# Altium project TC264.PrjPcb
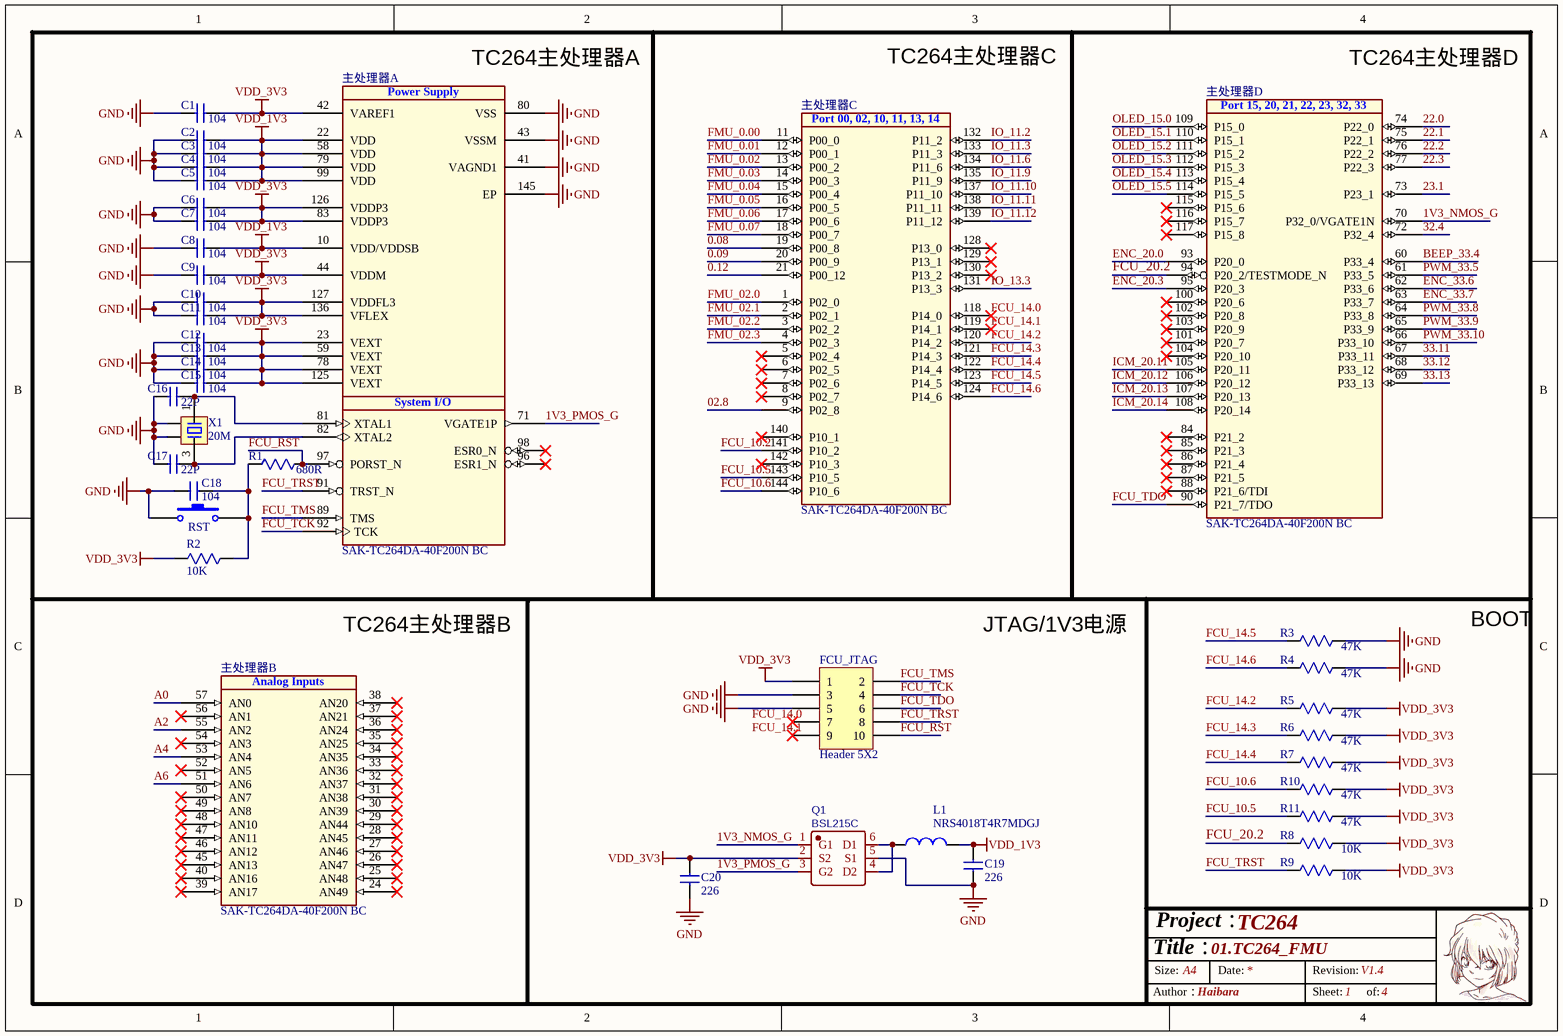
[diagram p0: 01.TC264_FMU.SchDoc]
3 sheets, 121 parts. Net scope: global (net labels, ports and power ports of the same name join across sheets).
Board file: TC264.PcbDoc
Sheets:
  01.TC264_FMU.SchDoc
  02.Power_Uint.SchDoc
  03.Communicate.SchDoc

## Sheet 01.TC264_FMU.SchDoc: 01.TC264_FMU
size A4; Revision: V1.4; SheetNumber: 1; SheetTotal: 4; Project: TC264

### Parts
C1  104  [C0402]
C2  104  [C0402]
C3  104  [C0402]
C4  104  [C0402]
C5  104  [C0402]
C6  104  [C0402]
C7  104  [C0402]
C8  104  [C0402]
C9  104  [C0402]
C10  104  [C0402]
C11  104  [C0402]
C12  104  [C0402]
C13  104  [C0402]
C14  104  [C0402]
C15  104  [C0402]
C16  22P  [C0603]
C17  22P  [C0603]
C18  104  [C0402]
C19  226  [C0805]
C20  226  [C0805]
FCU_JTAG  Header 5X2  [DC-2.54-L-Z-10P]
L1  NRS4018T4R7MDGJ  [SWPA4030S]
Q1  BSL215C  [SOT23-6]
R1  680R  [R0402]
R2  10K  [R0402]
R3  47K  [R0402]
R4  47K  [R0402]
R5  47K  [R0402]
R6  47K  [R0402]
R7  47K  [R0402]
R8  10K  [R0402]
R9  10K  [R0402]
R10  47K  [R0402]
R11  47K  [R0402]
RST  SW-PB  [TSW SMD-3*6*2.5]  (value not drawn)
X1  20M  [OSC 3225-4P]
主处理器  SAK-TC264DA-40F200N BC  [QFP144_EP]  (parts A,B,C,D of 4)

### Nets
GND: C1.1 C2.1 C3.1 C4.1 C5.1 C6.1 C7.1 C8.1 C9.1 C10.1 C11.1 C12.1 C13.1 C14.1 C15.1 C16.1 C17.1 C18.1 C19.1 C20.1 FCU_JTAG.3 FCU_JTAG.5 Q1.5(S1) R3.2 R4.2 RST.1 X1.2 X1.4 主处理器.41(VAGND1) 主处理器.43(VSSM) 主处理器.80(VSS) 主处理器.145(EP)
VDD_1V3: C2.2 C3.2 C4.2 C5.2 C8.2 C19.2 L1.2 主处理器.10(VDD/VDDSB) 主处理器.22(VDD) 主处理器.58(VDD) 主处理器.79(VDD) 主处理器.99(VDD)
VDD_3V3: C1.2 C6.2 C7.2 C9.2 C10.2 C11.2 C12.2 C13.2 C14.2 C15.2 C20.2 FCU_JTAG.1 Q1.2(S2) R2.1 R5.2 R6.2 R7.2 R8.2 R9.2 R10.2 R11.2 主处理器.23(VEXT) 主处理器.42(VAREF1) 主处理器.44(VDDM) 主处理器.59(VEXT) 主处理器.78(VEXT) 主处理器.83(VDDP3) 主处理器.125(VEXT) 主处理器.126(VDDP3) 主处理器.127(VDDFL3) 主处理器.136(VFLEX)
0.08: 主处理器.19(P00_8)
0.09: 主处理器.20(P00_9)
0.12: 主处理器.21(P00_12)
1V3_NMOS_G: Q1.1(G1) 主处理器.70(P32_0/VGATE1N)
1V3_PMOS_G: Q1.3(G2) 主处理器.71(VGATE1P)
02.8: 主处理器.9(P02_8)
22.0: 主处理器.74(P22_0)
22.1: 主处理器.75(P22_1)
22.2: 主处理器.76(P22_2)
22.3: 主处理器.77(P22_3)
23.1: 主处理器.73(P23_1)
32.4: 主处理器.72(P32_4)
33.11: 主处理器.67(P33_11)
33.12: 主处理器.68(P33_12)
33.13: 主处理器.69(P33_13)
A0: 主处理器.57(AN0)
A2: 主处理器.55(AN2)
A4: 主处理器.53(AN4)
A6: 主处理器.51(AN6)
BEEP_33.4: 主处理器.60(P33_4)
ENC_20.0: 主处理器.93(P20_0)
ENC_20.3: 主处理器.95(P20_3)
ENC_33.6: 主处理器.62(P33_6)
ENC_33.7: 主处理器.63(P33_7)
FCU_10.2: 主处理器.141(P10_2)
FCU_10.5: R11.1 主处理器.143(P10_5)
FCU_10.6: R10.1 主处理器.144(P10_6)
FCU_14.0: 主处理器.118(P14_0)
FCU_14.1: 主处理器.119(P14_1)
FCU_14.2: R5.1 主处理器.120(P14_2)
FCU_14.3: R6.1 主处理器.121(P14_3)
FCU_14.4: R7.1 主处理器.122(P14_4)
FCU_14.5: R3.1 主处理器.123(P14_5)
FCU_14.6: R4.1 主处理器.124(P14_6)
FCU_20.2: R8.1 主处理器.94(P20_2/TESTMODE_N)
FCU_RST: FCU_JTAG.10 R1.2 主处理器.97(PORST_N)
FCU_TCK: FCU_JTAG.4 主处理器.92(TCK)
FCU_TDO: FCU_JTAG.6 主处理器.90(P21_7/TDO)
FCU_TMS: FCU_JTAG.2 主处理器.89(TMS)
FCU_TRST: FCU_JTAG.8 R9.1 主处理器.91(TRST_N)
FMU_0.00: 主处理器.11(P00_0)
FMU_0.01: 主处理器.12(P00_1)
FMU_0.02: 主处理器.13(P00_2)
FMU_0.03: 主处理器.14(P00_3)
FMU_0.04: 主处理器.15(P00_4)
FMU_0.05: 主处理器.16(P00_5)
FMU_0.06: 主处理器.17(P00_6)
FMU_0.07: 主处理器.18(P00_7)
FMU_02.0: 主处理器.1(P02_0)
FMU_02.1: 主处理器.2(P02_1)
FMU_02.2: 主处理器.3(P02_2)
FMU_02.3: 主处理器.4(P02_3)
ICM_20.11: 主处理器.105(P20_11)
ICM_20.12: 主处理器.106(P20_12)
ICM_20.13: 主处理器.107(P20_13)
ICM_20.14: 主处理器.108(P20_14)
IO_11.2: 主处理器.132(P11_2)
IO_11.3: 主处理器.133(P11_3)
IO_11.6: 主处理器.134(P11_6)
IO_11.9: 主处理器.135(P11_9)
IO_11.10: 主处理器.137(P11_10)
IO_11.11: 主处理器.138(P11_11)
IO_11.12: 主处理器.139(P11_12)
IO_13.3: 主处理器.131(P13_3)
OLED_15.0: 主处理器.109(P15_0)
OLED_15.1: 主处理器.110(P15_1)
OLED_15.2: 主处理器.111(P15_2)
OLED_15.3: 主处理器.112(P15_3)
OLED_15.4: 主处理器.113(P15_4)
OLED_15.5: 主处理器.114(P15_5)
PWM_33.5: 主处理器.61(P33_5)
PWM_33.8: 主处理器.64(P33_8)
PWM_33.9: 主处理器.65(P33_9)
PWM_33.10: 主处理器.66(P33_10)
NetC16_2: C16.2 X1.1 主处理器.81(XTAL1)
NetC17_2: C17.2 X1.3 主处理器.82(XTAL2)
NetC18_2: C18.2 R1.1 R2.2 RST.2
NetL1_1: L1.1 Q1.4(D2) Q1.6(D1)

Not connected (* = marked no-connect by the designer): FCU_JTAG 7* 9*; 主处理器 5(P02_4)* 6(P02_5)* 7(P02_6)* 8(P02_7)* 24(AN49)* 25(AN48)* 26(AN47)* 27(AN46)* 28(AN45)* 29(AN44)* 30(AN39)* 31(AN38)* 32(AN37)* 33(AN36)* 34(AN35)* 35(AN25)* 36(AN24)* 37(AN21)* 38(AN20)* 39(AN17)* 40(AN16)* 45(AN13)* 46(AN12)* 47(AN11)* 48(AN10)* 49(AN8)* 50(AN7)* 52(AN5)* 54(AN3)* 56(AN1)* 84(P21_2)* 85(P21_3)* 86(P21_4)* 87(P21_5)* 88(P21_6/TDI)* 96(ESR1_N)* 98(ESR0_N)* 100(P20_6)* 101(P20_7)* 102(P20_8)* 103(P20_9)* 104(P20_10)* 115(P15_6)* 116(P15_7)* 117(P15_8)* 128(P13_0)* 129(P13_1)* 130(P13_2)* 140(P10_1)* 142(P10_3)*

### Notes on the sheet
- (near 主处理器) TC264主处理器A
- TC264主处理器C
- TC264主处理器D
- TC264主处理器B
- JTAG/1V3电源
- BOOT
- Labels drawn without touching a wire or pin: FCU_14.0, FCU_14.1
- Title：
- Size:
- Project：
- A4
- Date:
- Revision:
- Author：
- Haibara
- Sheet:
- of:
- (in symbol SAK-TC264DA-40F200N BC, part A) Power Supply; System I/O
- (in symbol SAK-TC264DA-40F200N BC, part B) Analog Inputs
- (in symbol SAK-TC264DA-40F200N BC, part C) Port 00, 02, 10, 11, 13, 14
- (in symbol SAK-TC264DA-40F200N BC, part D) Port 15, 20, 21, 22, 23, 32, 33

### Library data of the parts
C1-C20 = 电容
FCU_JTAG = Header 5X2: Header, 5-Pin, Dual row; LatestRevisionDate: 17-Jul-2002; LatestRevisionNote: Re-released for DXP Platform.; Publisher: Altium Limited
L1 = 电感
Q1 = BSL215CH6327XTSA1: BOM_Manufacturer: Infineon; Contributor: LCSC; BOM_Supplier: LCSC; BOM_Manufacturer Part: BSL215CH6327XTSA1; BOM_Supplier Part: C150914; BOM_JLCPCB Part Class: Extended Part; spicePre: Q; spiceSymbolName: BSL215CH6327XTSA1
R1-R11 = 电阻
RST = SW-PB: Switch; Published: 24-Mar-1999; LatestRevisionDate: 17-Jul-2002; LatestRevisionNote: Re-released for DXP Platform.; PackageReference: SPST-2; Publisher: Altium Limited; PackageDescription: Switch; 2 Leads
X1 = XTAL-4P: 4脚无源晶振; 版权归属: 源创客; BOM名称: 4脚无源晶振; 学习资源: www.ooocke.com
主处理器 = SAK-TC264DA-40F200N BC: 32-Bit Single-Chip Microcontroller BC-Step; Manufacturer: Infineon Technologies; PackageReference: PG-LQFP-144-22; ManufacturerPartNumber: SAK-TC264DA-40F200N BC

## Sheet 02.Power_Uint.SchDoc: 02.Power_Uint
size A4; Revision: V1.4; SheetNumber: 2; SheetTotal: 4; Project: TC264
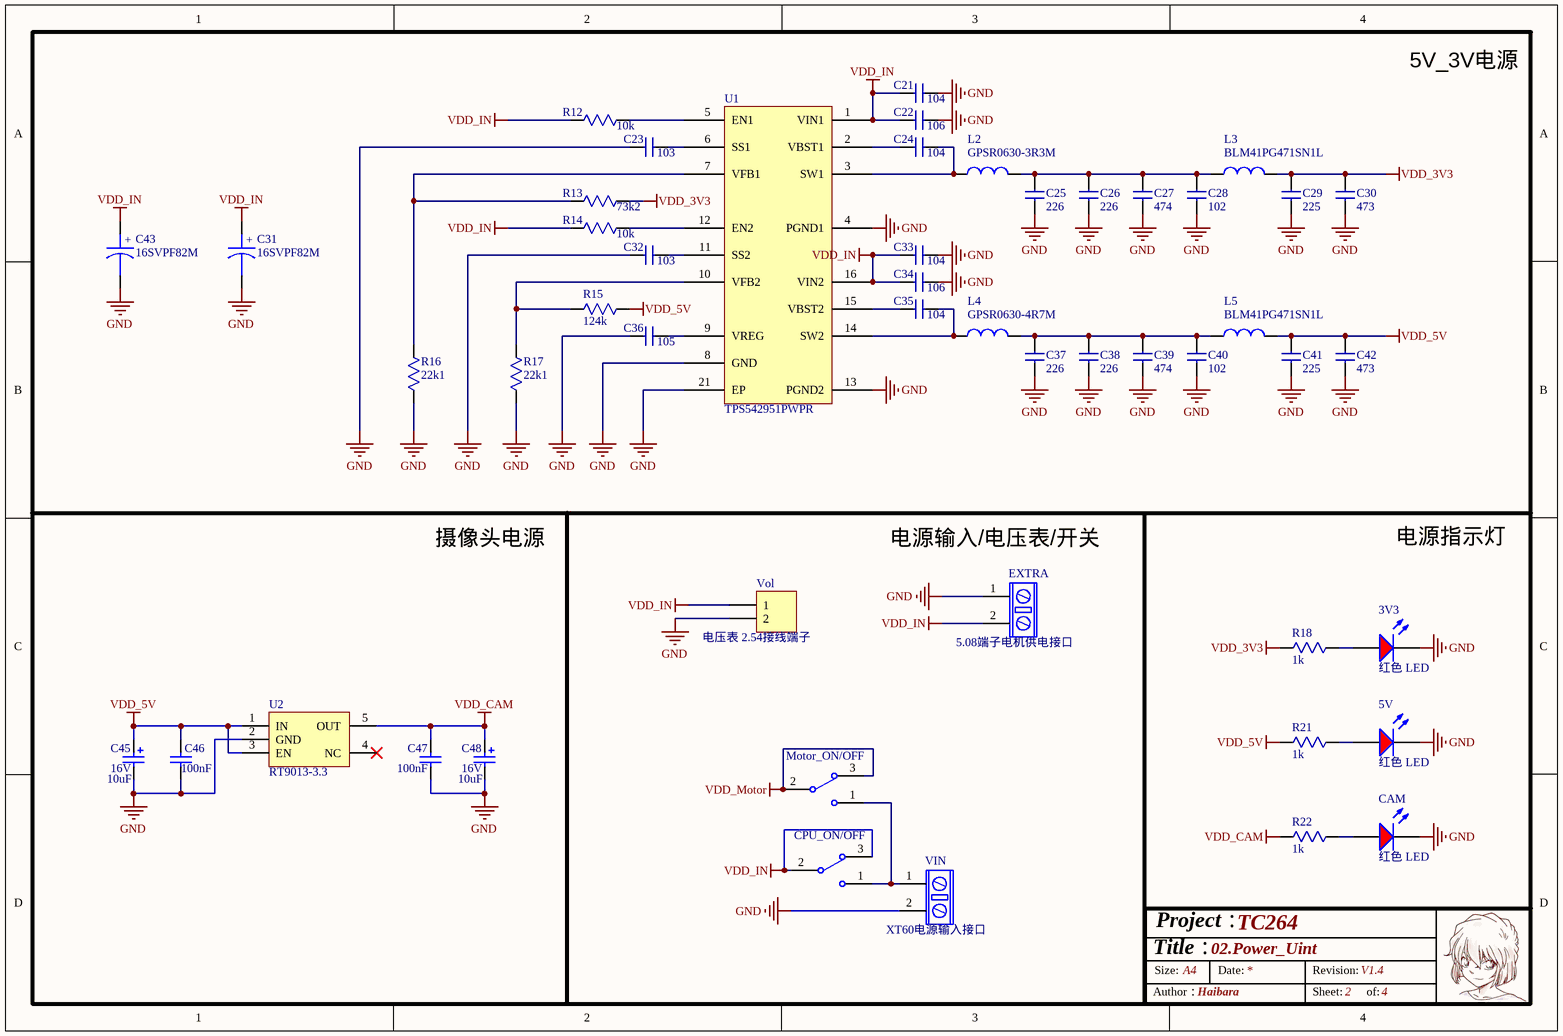
[diagram p1: 02.Power_Uint.SchDoc]

### Parts
3V3  红色 LED  [0603 LED R]
5V  红色 LED  [0603 LED R]
C21  104  [C0603]
C22  106  [C0805]
C23  103  [C0603]
C24  104  [C0805]
C25  226  [C0805]
C26  226  [C0805]
C27  474  [C0603]
C28  102  [C0603]
C29  225  [C0603]
C30  473  [C0603]
C31  16SVPF82M  [CE/3.5 *7.62-13]
C32  103  [C0603]
C33  104  [C0603]
C34  106  [C0805]
C35  104  [C0805]
C36  105  [C0603]
C37  226  [C0805]
C38  226  [C0805]
C39  474  [C0603]
C40  102  [C0603]
C41  225  [C0603]
C42  473  [C0603]
C43  16SVPF82M  [CE/3.5 *7.62-13]
C45  10UF  [C0805]
C46  100nF  [0603 电容 C3]
C47  100nF  [0603 电容 C3]
C48  10UF  [C0805]
CAM  红色 LED  [0603 LED R]
CPU_ON/OFF  SW-SPDT  [MTS-102S 两档纽子开关]  (value not drawn)
EXTRA  5.08端子电机供电接口  [5.08 2P 螺钉端子]
L2  GPSR0630-3R3M  [L 0630]
L3  BLM41PG471SN1L  [R1206]
L4  GPSR0630-4R7M  [L 0630]
L5  BLM41PG471SN1L  [R1206]
Motor_ON/OFF  SW-SPDT  [MTS-102S 两档纽子开关]  (value not drawn)
R12  10k  [R0603]
R13  73k2  [R0603]
R14  10k  [R0603]
R15  124k  [R0603]
R16  22k1  [R0603]
R17  22k1  [R0603]
R18  1k  [R0603]
R21  1k  [R0603]
R22  1k  [R0603]
U1  TPS542951PWPR  [SSOP16_EP]
U2  RT9013-3.3  [SOT23-5N]
VIN  XT60电源输入接口  [XT60 母头 电源接口]
Vol  电压表 2.54接线端子  [5.08 2P 螺钉端子]

### Nets
GND: 3V3.2 5V.2 C21.2 C22.2 C23.1 C25.1 C26.1 C27.1 C28.1 C29.1 C30.1 C31.2 C32.1 C33.2 C34.2 C36.1 C37.1 C38.1 C39.1 C40.1 C41.1 C42.1 C43.2 C45.2 C46.1 C47.1 C48.2 CAM.2 EXTRA.1 R16.1 R17.1 U1.4(PGND1) U1.8(GND) U1.13(PGND2) U1.21(EP) U2.2(GND) VIN.2 Vol.2
VDD_3V3: C29.2 C30.2 L3.2 R13.1 R18.1
VDD_5V: C41.2 C42.2 C45.1 C46.2 L5.2 R15.1 R21.1 U2.1(IN) U2.3(EN)
VDD_CAM: C47.2 C48.1 R22.1 U2.5(OUT)
VDD_IN: C21.1 C22.1 C31.1 C33.1 C34.1 C43.1 CPU_ON/OFF.2 CPU_ON/OFF.3 EXTRA.2 R12.2 R14.2 U1.1(VIN1) U1.16(VIN2) Vol.1
VDD_Motor: Motor_ON/OFF.2 Motor_ON/OFF.3
Net3V3_1: 3V3.1 R18.2
Net5V_1: 5V.1 R21.2
NetC23_2: C23.2 U1.6(SS1)
NetC24_1: C24.1 U1.2(VBST1)
NetC24_2: C24.2 L2.1 U1.3(SW1)
NetC25_2: C25.2 C26.2 C27.2 C28.2 L2.2 L3.1
NetC32_2: C32.2 U1.11(SS2)
NetC35_1: C35.1 U1.15(VBST2)
NetC35_2: C35.2 L4.1 U1.14(SW2)
NetC36_2: C36.2 U1.9(VREG)
NetC37_2: C37.2 C38.2 C39.2 C40.2 L4.2 L5.1
NetCAM_1: CAM.1 R22.2
NetCPU_ON/OFF_1: CPU_ON/OFF.1 Motor_ON/OFF.1 VIN.1
NetR12_1: R12.1 U1.5(EN1)
NetR13_2: R13.2 R16.2 U1.7(VFB1)
NetR14_1: R14.1 U1.12(EN2)
NetR15_2: R15.2 R17.2 U1.10(VFB2)

Not connected (* = marked no-connect by the designer): U2 4(NC)*

### Notes on the sheet
- Labels drawn without touching a wire or pin: 5V_3V电源, 摄像头电源, 电源指示灯, 电源输入/电压表/开关
- Title：
- Size:
- Project：
- A4
- Date:
- Revision:
- Author：
- Haibara
- Sheet:
- of:
- (in symbol CAP POL) +
- (in symbol Cap Pol2) 16V

### Library data of the parts
3V3 5V CAM = 红灯: 发光二极管; ComponentLink1Description: 供应商链接; ComponentLink1URL: http://www.szlcsc.com/product/details_2668.html; Package: 0805; Supplier: LC; SuppliersPartNumber: C2295
C21-C30 C32-C42 = 电容
C31 C43 = CAP POL: Capacitor
C45 C48 = Cap Pol2: Polarized Capacitor (Axial); Published: 8-Jun-2000; LatestRevisionDate: 17-Jul-2002; LatestRevisionNote: Re-released for DXP Platform.; PackageReference: POLAR0.8; Publisher: Altium Limited; PackageDescription: Polarized Capacitor; 2 Leads; Value: 10uF
C46 C47 = Cap: Capacitor; Published: 8-Jun-2000; LatestRevisionDate: 17-Jul-2002; LatestRevisionNote: Re-released for DXP Platform.; PackageReference: RAD-0.3; Publisher: Altium Limited; PackageDescription: Radial Cap, Thru-Hole; 2 Leads; 0.3 in Pin Spacing
CPU_ON/OFF Motor_ON/OFF = SW-SPDT: SPDT Subminiature Toggle Switch, Right Angle Mounting, Vertical Actuation; Published: 24-Mar-1999; LatestRevisionDate: 17-Dec-2003; LatestRevisionNote: Schematic revised, PCB Footprint replaced.; DatasheetVersion: 05-Dec-2000; PackageReference: TL36WW15050; Publisher: Altium Limited; PackageDescription: Switch; 4 Leads; ComponentLink1Description: Manufacturer Link; ComponentLink1URL: http://www.apem.com
EXTRA VIN = 电机供电接口
L2 L4 = 电感
L3 L5 = 磁珠: BLM18PG471SN1D
R12-R18 R21 R22 = 电阻
U2 = RT9013-3.3: 3.3V电源芯片
Vol = Header 2: Header, 2-Pin; LatestRevisionDate: 17-Jul-2002; LatestRevisionNote: Re-released for DXP Platform.; Publisher: Altium Limited

## Sheet 03.Communicate.SchDoc: 03.Communicate
size A4; Revision: V1.4; SheetNumber: 3; SheetTotal: 4; Project: TC264
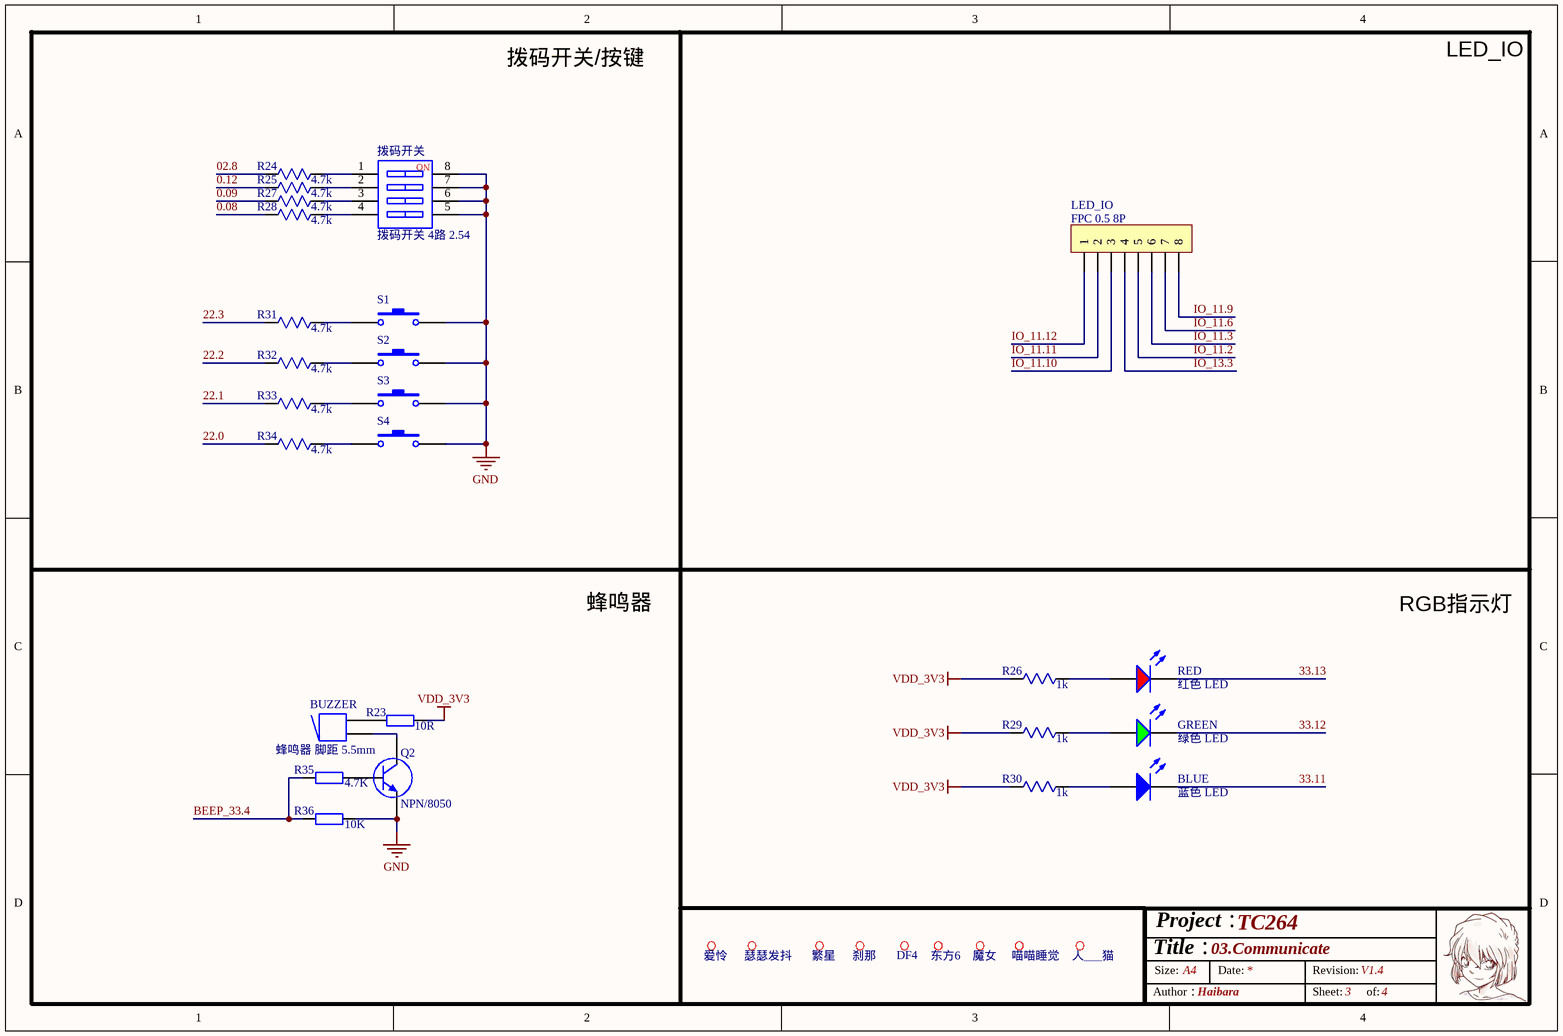
[diagram p2: 03.Communicate.SchDoc]

### Parts
(Parts that share a designator on the sheet are numbered #1, #2 ... from top to bottom, then left to right.)
?#1  爱怜  [爱怜]
?#2  瑟瑟发抖  [IMPORTED_IMAGE - duplicate6]
?#3  繁星  [繁星]
?#4  刹那  [刹那]
?#5  DF4  [DF4小]
?#6  魔女  [魔女小]
?#7  喵喵睡觉  [喵喵睡觉]
?#8  人___猫  [IMPORTED_IMAGE - duplicate2]
?#9  东方6  [IMPORTED_IMAGE - duplicate12]
BLUE  蓝色 LED  [0603 LED B]
BUZZER  蜂鸣器 脚距 5.5mm  [蜂鸣器5.5mm脚距]
GREEN  绿色 LED  [0603 LED G]
LED_IO  FPC 0.5 8P  [FPC0.5 2H-WS-8P]
Q2  NPN/8050  [SOT232-3 三极管]
R23  value 10R  [0603 电阻 R3]  (hidden comment: 4.7K)
R24  4.7k  [R0603]
R25  4.7k  [R0603]
R26  1k  [R0603]
R27  4.7k  [R0603]
R28  4.7k  [R0603]
R29  1k  [R0603]
R30  1k  [R0603]
R31  4.7k  [R0603]
R32  4.7k  [R0603]
R33  4.7k  [R0603]
R34  4.7k  [R0603]
R35  4.7K  [0603 电阻 R3]
R36  value 10K  [0603 电阻 R3]  (hidden comment: 4.7K)
RED  红色 LED  [0603 LED R]
S1  SW-PB  [TSW SMD-3*6*2.5]  (value not drawn)
S2  SW-PB  [TSW SMD-3*6*2.5]  (value not drawn)
S3  SW-PB  [TSW SMD-3*6*2.5]  (value not drawn)
S4  SW-PB  [TSW SMD-3*6*2.5]  (value not drawn)
拨码开关  拨码开关 4路 2.54  [CSW DIP-2P_G]

### Nets
GND: Q2.2(E) R36.2 S1.2 S2.2 S3.2 S4.2 拨码开关.5 拨码开关.6 拨码开关.7 拨码开关.8
VDD_3V3: R23.2 R26.1 R29.1 R30.1
0.08: R28.1
0.09: R27.1
0.12: R25.1
02.8: R24.1
22.0: R34.1
22.1: R33.1
22.2: R32.1
22.3: R31.1
33.11: BLUE.2
33.12: GREEN.2
33.13: RED.2
BEEP_33.4: R35.1 R36.1
IO_11.2: LED_IO.5
IO_11.3: LED_IO.6
IO_11.6: LED_IO.7
IO_11.9: LED_IO.8
IO_11.10: LED_IO.3
IO_11.11: LED_IO.2
IO_11.12: LED_IO.1
IO_13.3: LED_IO.4
NetBLUE_1: BLUE.1 R30.2
NetBUZZER_1: BUZZER.1 R23.1
NetBUZZER_2: BUZZER.2 Q2.3(C)
NetGREEN_1: GREEN.1 R29.2
NetQ2_1: Q2.1(B) R35.2
NetR24_2: R24.2 拨码开关.1
NetR25_2: R25.2 拨码开关.2
NetR26_2: R26.2 RED.1
NetR27_2: R27.2 拨码开关.3
NetR28_2: R28.2 拨码开关.4
NetR31_2: R31.2 S1.1
NetR32_2: R32.2 S2.1
NetR33_2: R33.2 S3.1
NetR34_2: R34.2 S4.1

### Notes on the sheet
- 拨码开关/按键
- LED_IO
- 蜂鸣器
- RGB指示灯
- Title：
- Size:
- Project：
- A4
- Date:
- Revision:
- Author：
- Haibara
- Sheet:
- of:
- (in symbol CSW-4P) NO

### Library data of the parts
BLUE = 蓝灯: 发光二极管; ComponentLink1Description: 供应商链接; ComponentLink1URL: http://www.szlcsc.com/product/details_2666.html; Package: 0805; Supplier: LC; SuppliersPartNumber: C2293
BUZZER = Buzzer: Magnetic Transducer Buzzer; Published: 24-Mar-1999; LatestRevisionDate: 17-Dec-2003; LatestRevisionNote: Schematic revised, PCB Footprint replaced.; DatasheetVersion: 17-Dec-2003; PackageReference: ABSM-1574; Publisher: Altium Limited; PackageDescription: Magnetic Transducer Buzzer; ComponentLink1Description: Manufacturer Link; ComponentLink1URL: http://www.megastar.com/linecard/buzzmode/index.php
GREEN = 绿灯: 发光二极管; ComponentLink1Description: 供应商链接; ComponentLink1URL: http://www.szlcsc.com/product/details_2670.html; Package: 0805; Supplier: LC; SuppliersPartNumber: C2297
LED_IO = Header 8: 8P接插件; 版权归属: 封装库来自淘宝 ID：黄晶宝石; BOM名称: 8P接插件; 学习资源: https://shop463601444.taobao.com
R23 R35 R36 = Res2: Resistor; Published: 8-Jun-2000; LatestRevisionDate: 17-Jul-2002; LatestRevisionNote: Re-released for DXP Platform.; PackageReference: AXIAL-0.4; Publisher: Altium Limited; PackageDescription: Axial Device, Thru-Hole; 2 Leads; 0.4 in Pin Spacing
  R35: Value: 4.7K
R24-R34 = 电阻
RED = 红灯: 发光二极管; ComponentLink1Description: 供应商链接; ComponentLink1URL: http://www.szlcsc.com/product/details_2668.html; Package: 0805; Supplier: LC; SuppliersPartNumber: C2295
S1-S4 = SW-PB: Switch; Published: 24-Mar-1999; LatestRevisionDate: 17-Jul-2002; LatestRevisionNote: Re-released for DXP Platform.; PackageReference: SPST-2; Publisher: Altium Limited; PackageDescription: Switch; 2 Leads
拨码开关 = CSW-4P: 4路编码开关; 版权归属: 源创客; BOM名称: 4路编码开关; 学习资源: www.ooocke.com

## Nets that join several sheets
GND: 01.TC264_FMU (32 pins), 02.Power_Uint (38 pins), 03.Communicate (10 pins)
VDD_3V3: 01.TC264_FMU (31 pins), 02.Power_Uint (5 pins), 03.Communicate (R23.2 R26.1 R29.1 R30.1)
0.08: 01.TC264_FMU (主处理器.19), 03.Communicate (R28.1)
0.09: 01.TC264_FMU (主处理器.20), 03.Communicate (R27.1)
0.12: 01.TC264_FMU (主处理器.21), 03.Communicate (R25.1)
02.8: 01.TC264_FMU (主处理器.9), 03.Communicate (R24.1)
22.0: 01.TC264_FMU (主处理器.74), 03.Communicate (R34.1)
22.1: 01.TC264_FMU (主处理器.75), 03.Communicate (R33.1)
22.2: 01.TC264_FMU (主处理器.76), 03.Communicate (R32.1)
22.3: 01.TC264_FMU (主处理器.77), 03.Communicate (R31.1)
33.11: 01.TC264_FMU (主处理器.67), 03.Communicate (BLUE.2)
33.12: 01.TC264_FMU (主处理器.68), 03.Communicate (GREEN.2)
33.13: 01.TC264_FMU (主处理器.69), 03.Communicate (RED.2)
BEEP_33.4: 01.TC264_FMU (主处理器.60), 03.Communicate (R35.1 R36.1)
IO_11.2: 01.TC264_FMU (主处理器.132), 03.Communicate (LED_IO.5)
IO_11.3: 01.TC264_FMU (主处理器.133), 03.Communicate (LED_IO.6)
IO_11.6: 01.TC264_FMU (主处理器.134), 03.Communicate (LED_IO.7)
IO_11.9: 01.TC264_FMU (主处理器.135), 03.Communicate (LED_IO.8)
IO_11.10: 01.TC264_FMU (主处理器.137), 03.Communicate (LED_IO.3)
IO_11.11: 01.TC264_FMU (主处理器.138), 03.Communicate (LED_IO.2)
IO_11.12: 01.TC264_FMU (主处理器.139), 03.Communicate (LED_IO.1)
IO_13.3: 01.TC264_FMU (主处理器.131), 03.Communicate (LED_IO.4)